# Altium schematic sheet ORing.SchDoc
size A; SheetNumber: 1; SheetTotal: 2
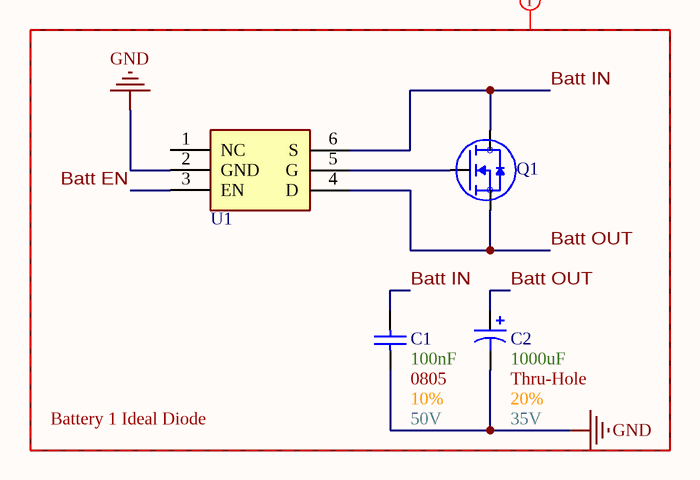
[diagram p0: ORing.SchDoc]

## Parts
C1  Max Voltage: 50V  Size Package: 0805  Tolerance: 10%  Capacitance: 100nF  [[Cap] SMD 0805]  (hidden comment: [Cap] 0805 0.1uF 10% 50V)
C2  Max Voltage: 35V  Size Package: Thru-Hole  Tolerance: 20%  Capacitance: 1000uF  [[Cap] Thru-Hole Polarized 10mm]  (hidden comment: [Cap] Thru-Hole 1000uF 20% 35V)
Q1  NMOS  [[NMOS] SMD 40V 509A]  (value not drawn)
U1  [ORing] NMOS Controller  [[ORing] NMOS Controller]  (value not drawn)

## Blocks framed on the sheet
Battery 1 Ideal Diode: C1 C2 Q1 U1

## Nets
GND: C1.2 C2.2 U1.2(GND)
Batt EN: U1.3(EN)
Batt IN: C1.1 Q1.3(Drain) U1.6(S)
Batt OUT: C2.1 Q1.1(Source) U1.4(D)
NetQ1_2: Q1.2(Gate) U1.5(G)

Not connected (* = marked no-connect by the designer): U1 1(NC)

## Layout directives
net class Supply_Nets: Batt EN, Batt IN, Batt OUT, GND

## Library data of the parts
C1 = [Cap] 0805 0.1uF 10% 50V: CL21B104KBCNNNC; Supplier 1: DigiKey; Supplier Part Number 1: 1276-1003-6-ND
C2 = [Cap] Thru-Hole 1000uF 20% 35V: 35PK1000MEFC10X20; Supplier 1: DigiKey; Supplier Part Number 1: 399-9886-1-ND
Q1 = [NMOS] SMD 40V 509A: NTMFS0D4N04XMT1G; Supplier 1: DigiKey; Supplier Part Number 1: 488-NTMFS0D4N04XMT1GCT-ND
U1 = [ORing] NMOS Controller: NCV68061SNAIT1G; Supplier 1: DigiKey; Supplier Part Number 1: 488-NCV68061SNAIT1GCT-ND